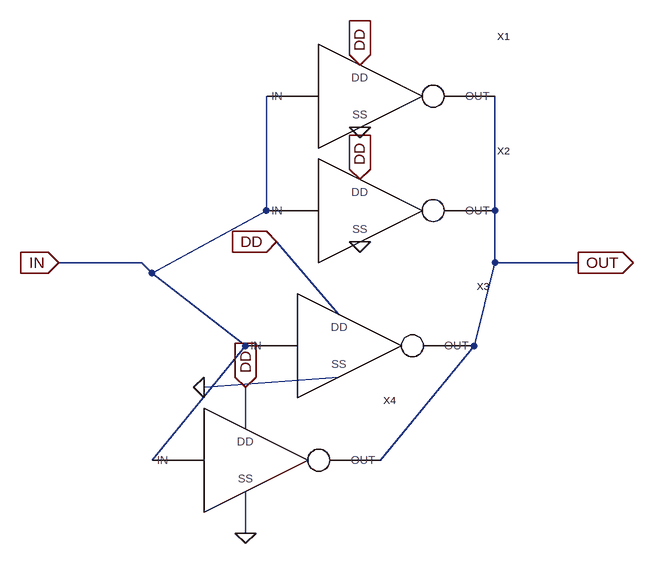
[diagram p0: schematic udcarga.asc]
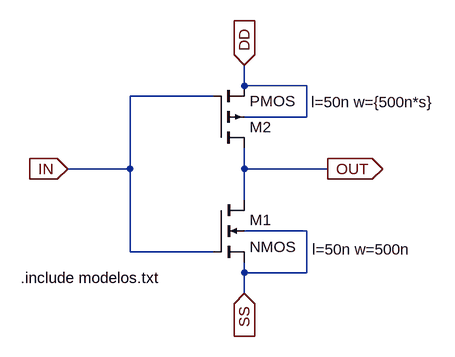
[diagram p1: sub-circuit inversorp.asc]
udcarga.asc, the LTspice schematic file:
Version 4
SHEET 1 880 820
WIRE -16 304 -16 128
WIRE 336 304 336 128
WIRE -208 384 -336 384
WIRE 336 384 336 304
WIRE 464 384 336 384
WIRE -192 400 -16 304
WIRE -192 400 -208 384
WIRE 96 464 0 352
WIRE -48 512 -192 400
WIRE 304 512 336 384
WIRE -112 576 96 560
WIRE -48 640 -48 576
WIRE -192 688 -48 512
WIRE 160 688 304 512
WIRE -48 800 -48 736
FLAG 464 384 OUT
IOPIN 464 384 Out
FLAG -336 384 IN
IOPIN -336 384 In
FLAG 128 80 DD
IOPIN 128 80 In
FLAG 128 256 DD
IOPIN 128 256 In
FLAG 0 352 DD
IOPIN 0 352 In
FLAG -48 576 DD
IOPIN -48 576 In
FLAG 128 176 0
FLAG 128 352 0
FLAG -112 576 0
FLAG -48 800 0
SYMBOL inversorp 64 128 R0
SYMATTR InstName X1
SYMBOL inversorp 64 304 R0
SYMATTR InstName X2
SYMBOL inversorp 32 512 R0
SYMATTR InstName X3
SYMBOL inversorp -112 688 R0
SYMATTR InstName X4

inversorp.asc, the sub-circuit schematic file:
Version 4
SHEET 1 1048 680
WIRE 112 32 112 0
WIRE 208 32 112 32
WIRE 64 48 -64 48
WIRE 208 80 208 32
WIRE 208 80 112 80
WIRE -64 160 -64 48
WIRE -64 160 -160 160
WIRE 112 160 112 128
WIRE 240 160 112 160
WIRE 112 208 112 160
WIRE 208 256 112 256
WIRE -64 288 -64 160
WIRE 64 288 -64 288
WIRE 112 320 112 304
WIRE 208 320 208 256
WIRE 208 320 112 320
WIRE 112 352 112 320
FLAG 112 0 DD
IOPIN 112 0 In
FLAG -160 160 IN
IOPIN -160 160 In
FLAG 240 160 OUT
IOPIN 240 160 Out
FLAG 112 352 SS
IOPIN 112 352 In
SYMBOL nmos4 64 208 R0
WINDOW 123 152 76 Left 2
WINDOW 0 56 31 Left 2
SYMATTR Value2 l=50n w=500n
SYMATTR InstName M1
SYMBOL pmos4 64 128 M180
WINDOW 123 151 71 Left 2
SYMATTR Value2 l=50n w={500n*s}
SYMATTR InstName M2
TEXT -232 328 Left 2 !.include modelos.txt

The netlist it stands for:
* udcarga.asc
XX1 DD 0 IN OUT inversorp params: s=2
XX2 DD 0 IN OUT inversorp params: s=2
XX3 DD 0 IN OUT inversorp params: s=2
XX4 DD 0 IN OUT inversorp params: s=2

* block symbol definitions
.subckt inversorp DD SS IN OUT
M1 OUT IN SS SS NMOS l=50n w=500n
M2 OUT IN DD DD PMOS l=50n w={500n*s}
.include modelos.txt
.ends inversorp

.model NMOS NMOS
.model PMOS PMOS
.lib standard.mos
.backanno
.end